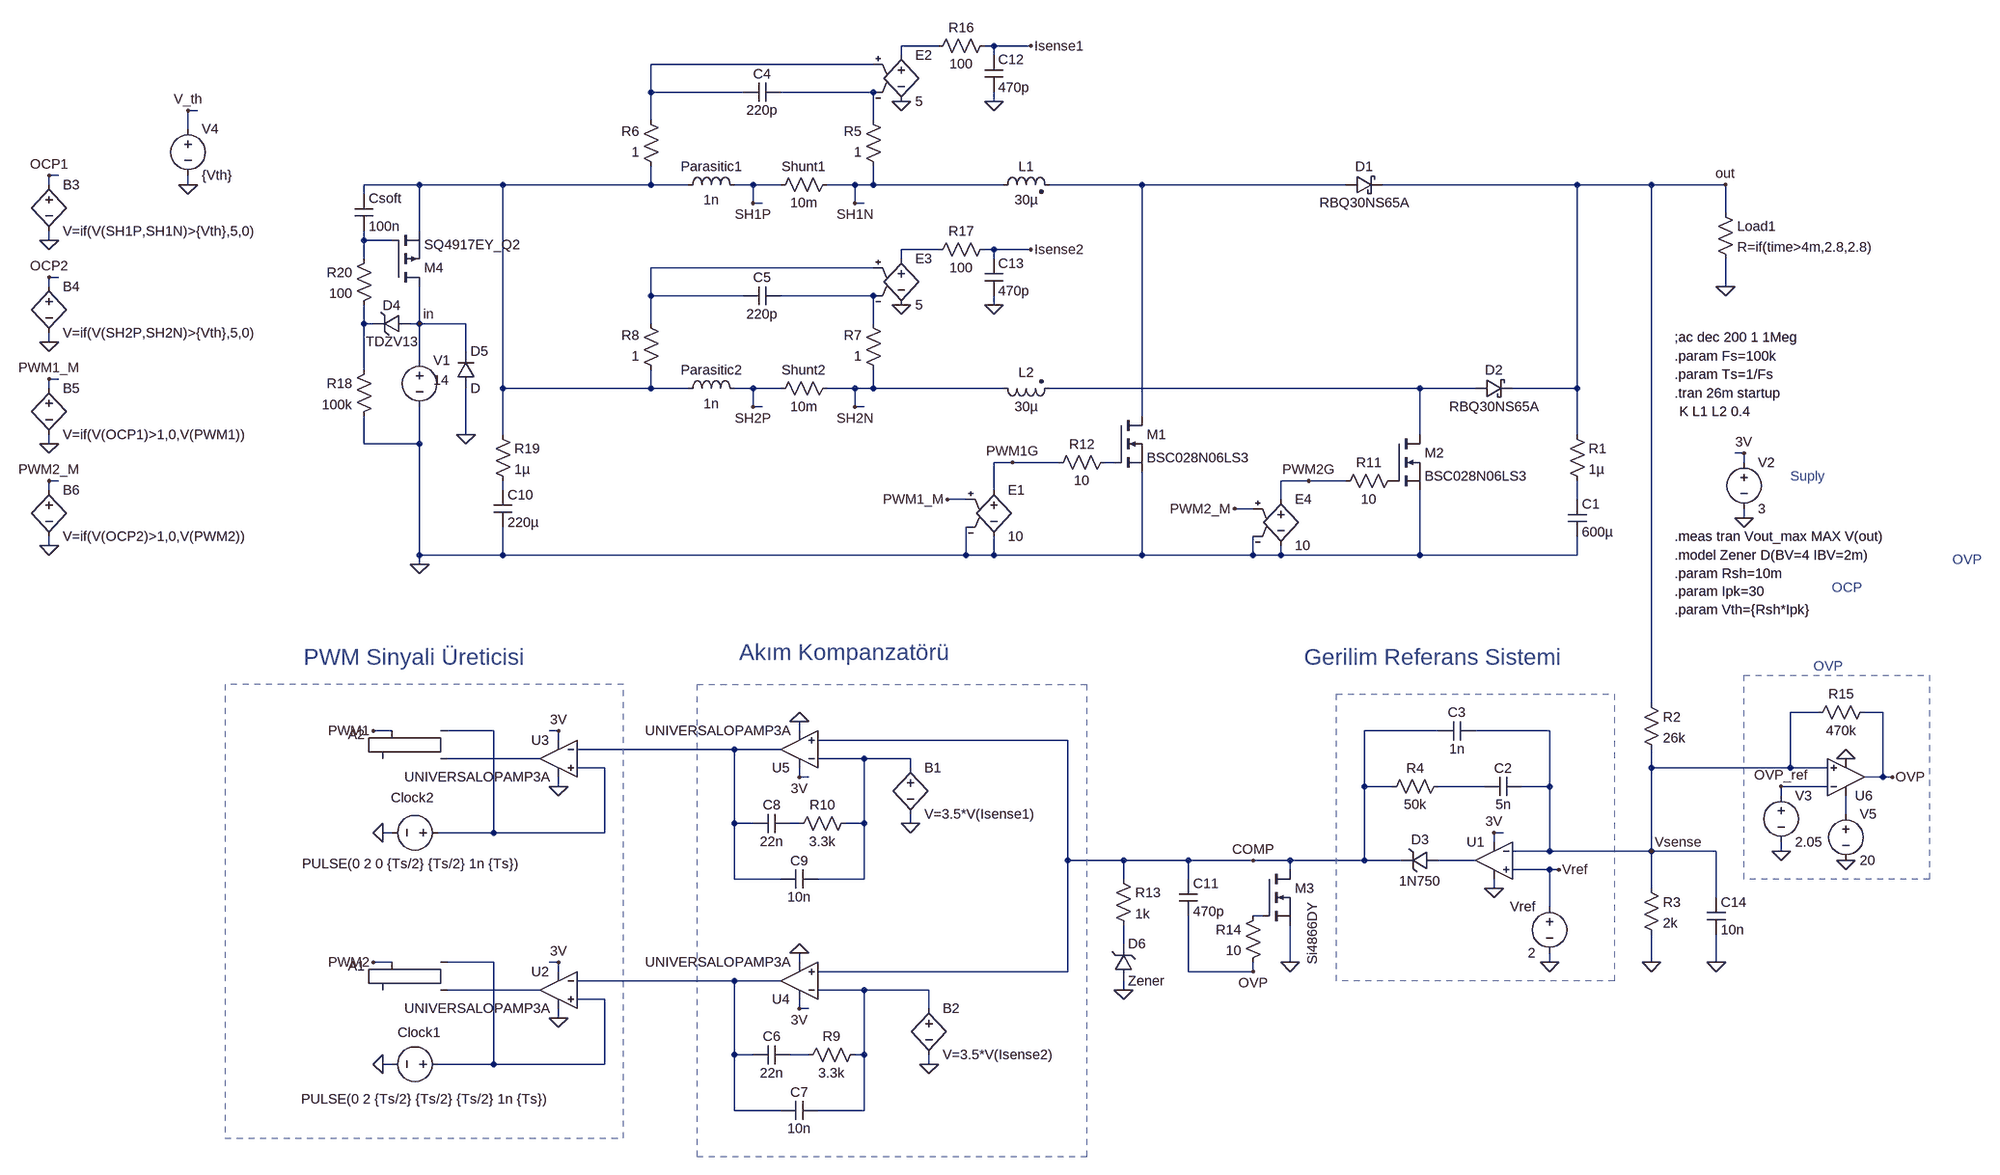
[diagram p0: schematic Analog_ACMC_variant.asc]
Analog_ACMC_variant.asc, the LTspice schematic file:
Version 4
SHEET 1 4392 1352
WIRE -112 -816 -176 -816
WIRE -16 -816 -32 -816
WIRE 48 -816 -16 -816
WIRE -176 -800 -176 -816
WIRE -16 -800 -16 -816
WIRE -224 -784 -608 -784
WIRE -608 -736 -608 -784
WIRE -448 -736 -608 -736
WIRE -224 -736 -384 -736
WIRE -16 -720 -16 -736
WIRE -1392 -704 -1408 -704
WIRE -608 -688 -608 -736
WIRE -224 -688 -224 -736
WIRE -1408 -672 -1408 -704
WIRE -1632 -592 -1648 -592
WIRE -1648 -576 -1648 -592
WIRE -1408 -576 -1408 -592
WIRE -1008 -576 -1104 -576
WIRE -864 -576 -1008 -576
WIRE -608 -576 -608 -608
WIRE -608 -576 -864 -576
WIRE -544 -576 -608 -576
WIRE -432 -576 -464 -576
WIRE -384 -576 -432 -576
WIRE -256 -576 -304 -576
WIRE -224 -576 -224 -608
WIRE -224 -576 -256 -576
WIRE 0 -576 -224 -576
WIRE 240 -576 80 -576
WIRE 592 -576 240 -576
WIRE 992 -576 656 -576
WIRE 1120 -576 992 -576
WIRE 1248 -576 1120 -576
WIRE -1104 -560 -1104 -576
WIRE -432 -544 -432 -576
WIRE -416 -544 -432 -544
WIRE -256 -544 -256 -576
WIRE -240 -544 -256 -544
WIRE 1248 -528 1248 -576
WIRE -1008 -496 -1008 -576
WIRE -1648 -480 -1648 -496
WIRE -1104 -480 -1104 -496
WIRE -1056 -480 -1104 -480
WIRE -112 -464 -176 -464
WIRE -16 -464 -32 -464
WIRE 48 -464 -16 -464
WIRE -1104 -448 -1104 -480
WIRE -176 -448 -176 -464
WIRE -16 -448 -16 -464
WIRE -224 -432 -608 -432
WIRE -1632 -416 -1648 -416
WIRE -1648 -400 -1648 -416
WIRE 1248 -400 1248 -448
WIRE -608 -384 -608 -432
WIRE -448 -384 -608 -384
WIRE -224 -384 -384 -384
WIRE -16 -368 -16 -384
WIRE -1104 -336 -1104 -368
WIRE -1088 -336 -1104 -336
WIRE -1008 -336 -1008 -400
WIRE -1008 -336 -1024 -336
WIRE -928 -336 -1008 -336
WIRE -608 -336 -608 -384
WIRE -224 -336 -224 -384
WIRE -1648 -304 -1648 -320
WIRE -928 -288 -928 -336
WIRE -1008 -272 -1008 -336
WIRE -1104 -256 -1104 -336
WIRE -1632 -240 -1648 -240
WIRE -1648 -224 -1648 -240
WIRE -864 -224 -864 -576
WIRE -608 -224 -608 -256
WIRE -608 -224 -864 -224
WIRE -544 -224 -608 -224
WIRE -432 -224 -464 -224
WIRE -384 -224 -432 -224
WIRE -256 -224 -304 -224
WIRE -224 -224 -224 -256
WIRE -224 -224 -256 -224
WIRE 0 -224 -224 -224
WIRE 720 -224 80 -224
WIRE 816 -224 720 -224
WIRE 992 -224 992 -576
WIRE 992 -224 880 -224
WIRE -432 -192 -432 -224
WIRE -416 -192 -432 -192
WIRE -256 -192 -256 -224
WIRE -240 -192 -256 -192
WIRE 240 -176 240 -576
WIRE -928 -144 -928 -224
WIRE -864 -144 -864 -224
WIRE 720 -144 720 -224
WIRE 992 -144 992 -224
WIRE -1648 -128 -1648 -144
WIRE -1104 -128 -1104 -176
WIRE -1008 -128 -1008 -192
WIRE -1008 -128 -1104 -128
WIRE 1280 -112 1264 -112
WIRE 16 -96 -16 -96
WIRE 96 -96 16 -96
WIRE 192 -96 176 -96
WIRE 1280 -96 1280 -112
WIRE -1632 -64 -1648 -64
WIRE 528 -64 480 -64
WIRE 592 -64 528 -64
WIRE -1648 -48 -1648 -64
WIRE -864 -48 -864 -64
WIRE -16 -48 -16 -96
WIRE -64 -32 -96 -32
WIRE 480 -32 480 -64
WIRE 992 -32 992 -64
WIRE 432 -16 400 -16
WIRE 1280 0 1280 -16
WIRE -1648 48 -1648 32
WIRE -1008 64 -1008 -128
WIRE -864 64 -864 16
WIRE -864 64 -1008 64
WIRE -64 64 -64 16
WIRE -64 64 -864 64
WIRE -16 64 -16 32
WIRE -16 64 -64 64
WIRE 240 64 240 -80
WIRE 240 64 -16 64
WIRE 432 64 432 32
WIRE 432 64 240 64
WIRE 480 64 480 48
WIRE 480 64 432 64
WIRE 720 64 720 -48
WIRE 720 64 480 64
WIRE 992 64 992 32
WIRE 992 64 720 64
WIRE -1008 80 -1008 64
WIRE 1120 320 1120 -576
WIRE 1408 336 1360 336
WIRE 1520 336 1488 336
WIRE -1056 368 -1088 368
WIRE -880 368 -960 368
WIRE -768 368 -784 368
WIRE -352 368 -352 352
WIRE 752 368 624 368
WIRE 944 368 816 368
WIRE -768 384 -768 368
WIRE 112 384 -320 384
WIRE -464 400 -736 400
WIRE -384 400 -464 400
WIRE -800 416 -960 416
WIRE -240 416 -320 416
WIRE -160 416 -240 416
WIRE -688 432 -736 432
WIRE -160 432 -160 416
WIRE 1120 432 1120 400
WIRE 1360 432 1360 336
WIRE 1360 432 1120 432
WIRE 1424 432 1360 432
WIRE 1456 432 1456 416
WIRE -352 448 -352 432
WIRE -336 448 -352 448
WIRE 1520 448 1520 336
WIRE 1520 448 1488 448
WIRE 1536 448 1520 448
WIRE -768 464 -768 448
WIRE 624 464 624 368
WIRE 672 464 624 464
WIRE 832 464 752 464
WIRE 944 464 944 368
WIRE 944 464 896 464
WIRE 1424 464 1344 464
WIRE 1344 480 1344 464
WIRE 1456 512 1456 480
WIRE -464 528 -464 400
WIRE -432 528 -464 528
WIRE -352 528 -368 528
WIRE -240 528 -240 416
WIRE -240 528 -272 528
WIRE -160 528 -160 512
WIRE -1056 544 -1072 544
WIRE -880 544 -880 368
WIRE -880 544 -976 544
WIRE -688 544 -688 432
WIRE -688 544 -880 544
WIRE 864 544 848 544
WIRE 848 560 848 544
WIRE 944 576 944 464
WIRE 944 576 880 576
WIRE 1120 576 1120 432
WIRE 1120 576 944 576
WIRE 1232 576 1120 576
WIRE 1344 576 1344 560
WIRE 112 592 112 384
WIRE 208 592 112 592
WIRE 320 592 208 592
WIRE 432 592 320 592
WIRE 496 592 432 592
WIRE 624 592 624 464
WIRE 624 592 496 592
WIRE 688 592 624 592
WIRE 816 592 752 592
WIRE 496 608 496 592
WIRE 944 608 880 608
WIRE 960 608 944 608
WIRE -464 624 -464 528
WIRE -384 624 -464 624
WIRE -240 624 -240 528
WIRE -240 624 -320 624
WIRE 208 624 208 592
WIRE 320 624 320 592
WIRE 848 640 848 624
WIRE 1120 640 1120 576
WIRE 1232 656 1232 576
WIRE 944 672 944 608
WIRE 448 688 432 688
WIRE 208 736 208 704
WIRE -1056 768 -1088 768
WIRE -880 768 -960 768
WIRE -768 768 -784 768
WIRE -352 768 -352 752
WIRE 496 768 496 704
WIRE 944 768 944 752
WIRE 1120 768 1120 720
WIRE 1232 768 1232 720
WIRE -768 784 -768 768
WIRE 112 784 112 592
WIRE 112 784 -320 784
WIRE 320 784 320 688
WIRE 432 784 432 768
WIRE 432 784 320 784
WIRE -464 800 -736 800
WIRE -384 800 -464 800
WIRE -800 816 -960 816
WIRE -240 816 -320 816
WIRE -128 816 -240 816
WIRE 208 816 208 800
WIRE -688 832 -736 832
WIRE -352 848 -352 832
WIRE -336 848 -352 848
WIRE -128 848 -128 816
WIRE -768 864 -768 848
WIRE -464 928 -464 800
WIRE -432 928 -464 928
WIRE -336 928 -368 928
WIRE -240 928 -240 816
WIRE -240 928 -256 928
WIRE -1056 944 -1072 944
WIRE -880 944 -880 768
WIRE -880 944 -976 944
WIRE -688 944 -688 832
WIRE -688 944 -880 944
WIRE -128 944 -128 928
WIRE -464 1024 -464 928
WIRE -384 1024 -464 1024
WIRE -240 1024 -240 928
WIRE -240 1024 -320 1024
FLAG -1008 80 0
FLAG -1008 -336 in
FLAG 1248 -576 out
FLAG 1120 768 0
FLAG 1280 0 0
FLAG 944 768 0
FLAG 1280 -112 3V
FLAG 848 640 0
FLAG -176 -720 0
FLAG -1072 944 0
FLAG 1248 -400 0
FLAG 48 -816 Isense1
FLAG -768 864 0
FLAG -176 -368 0
FLAG 48 -464 Isense2
FLAG -768 464 0
FLAG -1072 544 0
FLAG -160 528 0
FLAG -128 944 0
FLAG -352 752 0
FLAG -352 352 0
FLAG 960 608 Vref
FLAG 1120 576 Vsense
FLAG -1088 368 PWM1
FLAG -1088 768 PWM2
FLAG -96 -32 PWM1_M
FLAG 400 -16 PWM2_M
FLAG 208 816 0
FLAG 848 544 3V
FLAG -768 368 3V
FLAG 1456 416 0
FLAG 1536 448 OVP
FLAG 496 768 0
FLAG 1344 576 0
FLAG 1344 464 OVP_ref
FLAG 1456 592 0
FLAG 432 784 OVP
FLAG -16 -720 0
FLAG -16 -368 0
FLAG 16 -96 PWM1G
FLAG 528 -64 PWM2G
FLAG -432 -544 SH1P
FLAG -256 -544 SH1N
FLAG -432 -192 SH2P
FLAG -256 -192 SH2N
FLAG -1648 -480 0
FLAG -1648 -304 0
FLAG -1648 -592 OCP1
FLAG -1648 -416 OCP2
FLAG -1648 -128 0
FLAG -1648 48 0
FLAG -1648 -240 PWM1_M
FLAG -1648 -64 PWM2_M
FLAG -1408 -576 0
FLAG -1408 -704 V_th
FLAG 432 592 COMP
FLAG 1232 768 0
FLAG -928 -144 0
FLAG -352 448 3V
FLAG -352 848 3V
FLAG -768 768 3V
SYMBOL res 1232 -544 R0
SYMATTR InstName Load1
SYMATTR Value R=if(time>4m,2.8,2.8)
SYMBOL nmos 192 -176 R0
SYMATTR InstName M1
SYMATTR Value BSC028N06LS3
SYMBOL ind2 -16 -560 R270
WINDOW 0 32 56 VTop 2
WINDOW 3 5 56 VBottom 2
SYMATTR InstName L1
SYMATTR Value 30µ
SYMATTR Type ind
SYMATTR SpiceLine Rser=1u
SYMBOL res -400 -560 R270
WINDOW 0 32 56 VTop 2
WINDOW 3 0 56 VBottom 2
SYMATTR InstName Shunt1
SYMATTR Value 10m
SYMBOL res 976 -160 R0
SYMATTR InstName R1
SYMATTR Value 1µ
SYMBOL cap 976 -32 R0
SYMATTR InstName C1
SYMATTR Value 600µ
SYMBOL e -16 -64 R0
SYMATTR InstName E1
SYMATTR Value 10
SYMBOL Digital\\srflop -1008 720 M0
SYMATTR InstName A1
SYMBOL res 1104 304 R0
SYMATTR InstName R2
SYMATTR Value 26k
SYMBOL res 1104 624 R0
SYMATTR InstName R3
SYMATTR Value 2k
SYMBOL voltage 1280 -112 R0
WINDOW 123 0 0 Left 0
WINDOW 39 0 0 Left 0
SYMATTR InstName V2
SYMATTR Value 3
SYMBOL OpAmps\\UniversalOpAmp2 848 592 M0
SYMATTR InstName U1
SYMBOL res 768 448 R90
WINDOW 0 0 56 VBottom 2
WINDOW 3 32 56 VTop 2
SYMATTR InstName R4
SYMATTR Value 50k
SYMBOL cap 896 448 R90
WINDOW 0 0 32 VBottom 2
WINDOW 3 32 32 VTop 2
SYMATTR InstName C2
SYMATTR Value 5n
SYMBOL cap 752 384 R270
WINDOW 0 32 32 VTop 2
WINDOW 3 0 32 VBottom 2
SYMATTR InstName C3
SYMATTR Value 1n
SYMBOL ind -560 -560 R270
WINDOW 0 32 56 VTop 2
WINDOW 3 5 56 VBottom 2
SYMATTR InstName Parasitic1
SYMATTR Value 1n
SYMBOL res -208 -592 R180
WINDOW 0 36 76 Left 2
WINDOW 3 36 40 Left 2
SYMATTR InstName R5
SYMATTR Value 1
SYMBOL res -592 -592 R180
WINDOW 0 36 76 Left 2
WINDOW 3 36 40 Left 2
SYMATTR InstName R6
SYMATTR Value 1
SYMBOL cap -448 -720 R270
WINDOW 0 32 32 VTop 2
WINDOW 3 0 32 VBottom 2
SYMATTR InstName C4
SYMATTR Value 220p
SYMBOL e -176 -816 R0
SYMATTR InstName E2
SYMATTR Value 5
SYMBOL voltage -960 944 R90
WINDOW 0 -70 49 VTop 2
WINDOW 3 76 41 VBottom 2
WINDOW 123 0 0 Left 0
WINDOW 39 0 0 Left 0
SYMATTR InstName Clock1
SYMATTR Value PULSE(0 2 {Ts/2} {Ts/2} {Ts/2} 1n {Ts})
SYMBOL OpAmps\\UniversalOpAmp3a -768 816 M0
SYMATTR InstName U2
SYMBOL schottky 592 -560 R270
WINDOW 0 32 32 VTop 2
WINDOW 3 0 32 VBottom 2
SYMATTR InstName D1
SYMATTR Value RBQ30NS65A
SYMATTR Description Diode
SYMATTR Type diode
SYMBOL ind2 -16 -240 M90
WINDOW 0 4 56 VBottom 2
WINDOW 3 32 56 VTop 2
SYMATTR InstName L2
SYMATTR Value 30µ
SYMATTR Type ind
SYMATTR SpiceLine Rser=1u
SYMBOL schottky 816 -208 R270
WINDOW 0 32 32 VTop 2
WINDOW 3 0 32 VBottom 2
SYMATTR InstName D2
SYMATTR Value RBQ30NS65A
SYMATTR Description Diode
SYMATTR Type diode
SYMBOL nmos 672 -144 R0
SYMATTR InstName M2
SYMATTR Value BSC028N06LS3
SYMBOL res -400 -208 R270
WINDOW 0 32 56 VTop 2
WINDOW 3 0 56 VBottom 2
SYMATTR InstName Shunt2
SYMATTR Value 10m
SYMBOL ind -560 -208 R270
WINDOW 0 32 56 VTop 2
WINDOW 3 5 56 VBottom 2
SYMATTR InstName Parasitic2
SYMATTR Value 1n
SYMBOL res -208 -240 R180
WINDOW 0 36 76 Left 2
WINDOW 3 36 40 Left 2
SYMATTR InstName R7
SYMATTR Value 1
SYMBOL res -592 -240 R180
WINDOW 0 36 76 Left 2
WINDOW 3 36 40 Left 2
SYMATTR InstName R8
SYMATTR Value 1
SYMBOL cap -448 -368 R270
WINDOW 0 32 32 VTop 2
WINDOW 3 0 32 VBottom 2
SYMATTR InstName C5
SYMATTR Value 220p
SYMBOL e -176 -464 R0
SYMATTR InstName E3
SYMATTR Value 5
SYMBOL OpAmps\\UniversalOpAmp3a -768 416 M0
SYMATTR InstName U3
SYMBOL bv -160 416 R0
SYMATTR InstName B1
SYMATTR Value V=3.5*V(Isense1)
SYMBOL Digital\\srflop -1008 320 M0
SYMATTR InstName A2
SYMBOL voltage -960 544 R90
WINDOW 0 -76 61 VTop 2
WINDOW 3 69 64 VBottom 2
WINDOW 123 0 0 Left 0
WINDOW 39 0 0 Left 0
SYMATTR InstName Clock2
SYMATTR Value PULSE(0 2 0 {Ts/2} {Ts/2} 1n {Ts})
SYMBOL e 480 -48 R0
SYMATTR InstName E4
SYMATTR Value 10
SYMBOL zener 752 576 R90
WINDOW 0 -4 32 VBottom 2
WINDOW 3 36 32 VTop 2
SYMATTR InstName D3
SYMATTR Value 1N750
SYMBOL bv -128 832 R0
SYMATTR InstName B2
SYMATTR Value V=3.5*V(Isense2)
SYMBOL OpAmps\\UniversalOpAmp3a -352 800 R180
SYMATTR InstName U4
SYMBOL res -352 944 R270
WINDOW 0 32 56 VTop 2
WINDOW 3 0 56 VBottom 2
SYMATTR InstName R9
SYMATTR Value 3.3k
SYMBOL cap -432 944 R270
WINDOW 0 32 32 VTop 2
WINDOW 3 0 32 VBottom 2
SYMATTR InstName C6
SYMATTR Value 22n
SYMBOL cap -320 1008 R90
WINDOW 0 0 32 VBottom 2
WINDOW 3 32 32 VTop 2
SYMATTR InstName C7
SYMATTR Value 10n
SYMBOL OpAmps\\UniversalOpAmp3a -352 400 R180
SYMATTR InstName U5
SYMBOL res -368 544 R270
WINDOW 0 32 56 VTop 2
WINDOW 3 0 56 VBottom 2
SYMATTR InstName R10
SYMATTR Value 3.3k
SYMBOL cap -432 544 R270
WINDOW 0 32 32 VTop 2
WINDOW 3 0 32 VBottom 2
SYMATTR InstName C8
SYMATTR Value 22n
SYMBOL cap -320 608 R90
WINDOW 0 0 32 VBottom 2
WINDOW 3 32 32 VTop 2
SYMATTR InstName C9
SYMATTR Value 10n
SYMBOL res 688 -80 R90
WINDOW 0 0 56 VBottom 2
WINDOW 3 32 56 VTop 2
SYMATTR InstName R11
SYMATTR Value 10
SYMBOL res 192 -112 R90
WINDOW 0 0 56 VBottom 2
WINDOW 3 32 56 VTop 2
SYMATTR InstName R12
SYMATTR Value 10
SYMBOL cap -880 -48 R0
SYMATTR InstName C10
SYMATTR Value 220µ
SYMBOL res 192 608 R0
SYMATTR InstName R13
SYMATTR Value 1k
SYMBOL voltage 944 656 M0
WINDOW 123 0 0 Left 0
WINDOW 39 0 0 Left 0
SYMATTR InstName Vref
SYMATTR Value 2
SYMBOL OpAmps\\UniversalOpAmp2 1456 448 M180
SYMATTR InstName U6
SYMBOL zener 192 800 M180
WINDOW 0 24 64 Left 2
WINDOW 3 24 0 Left 2
SYMATTR InstName D6
SYMATTR Value Zener
SYMATTR Description Diode
SYMATTR Type diode
SYMBOL nmos 448 608 R0
WINDOW 3 87 56 VRight 2
SYMATTR Value Si4866DY
SYMATTR InstName M3
SYMBOL voltage 1344 464 R0
WINDOW 123 0 0 Left 0
WINDOW 39 0 0 Left 0
SYMATTR InstName V3
SYMATTR Value 2.05
SYMBOL res 448 672 M0
SYMATTR InstName R14
SYMATTR Value 10
SYMBOL cap 304 624 R0
SYMATTR InstName C11
SYMATTR Value 470p
SYMBOL voltage 1456 496 R0
WINDOW 123 0 0 Left 0
WINDOW 39 0 0 Left 0
SYMATTR InstName V5
SYMATTR Value 20
SYMBOL res 1504 320 R90
WINDOW 0 0 56 VBottom 2
WINDOW 3 32 56 VTop 2
SYMATTR InstName R15
SYMATTR Value 470k
SYMBOL res -16 -832 R90
WINDOW 0 0 56 VBottom 2
WINDOW 3 32 56 VTop 2
SYMATTR InstName R16
SYMATTR Value 100
SYMBOL cap -32 -800 R0
SYMATTR InstName C12
SYMATTR Value 470p
SYMBOL cap -32 -448 R0
SYMATTR InstName C13
SYMATTR Value 470p
SYMBOL res -16 -480 R90
WINDOW 0 0 56 VBottom 2
WINDOW 3 32 56 VTop 2
SYMATTR InstName R17
SYMATTR Value 100
SYMBOL bv -1648 -592 R0
SYMATTR InstName B3
SYMATTR Value V=if(V(SH1P,SH1N)>{Vth},5,0)
SYMBOL bv -1648 -416 R0
SYMATTR InstName B4
SYMATTR Value V=if(V(SH2P,SH2N)>{Vth},5,0)
SYMBOL bv -1648 -240 R0
SYMATTR InstName B5
SYMATTR Value V=if(V(OCP1)>1,0,V(PWM1))
SYMBOL bv -1648 -64 R0
SYMATTR InstName B6
SYMATTR Value V=if(V(OCP2)>1,0,V(PWM2))
SYMBOL voltage -1408 -688 R0
SYMATTR InstName V4
SYMATTR Value {Vth}
SYMBOL pmos -1056 -400 M180
SYMATTR InstName M4
SYMATTR Value SQ4917EY_Q2
SYMBOL res -1088 -272 M0
SYMATTR InstName R18
SYMATTR Value 100k
SYMBOL zener -1024 -352 R90
WINDOW 0 0 32 VBottom 2
WINDOW 3 32 32 VTop 2
SYMATTR InstName D4
SYMATTR Value TDZV13
SYMATTR Description Diode
SYMATTR Type diode
SYMBOL res -880 -160 R0
SYMATTR InstName R19
SYMATTR Value 1µ
SYMBOL voltage -1008 -288 R0
WINDOW 123 24 50 Left 2
WINDOW 39 0 0 Left 0
WINDOW 3 24 50 Left 2
SYMATTR Value 14
SYMATTR InstName V1
SYMBOL cap 1216 656 R0
SYMATTR InstName C14
SYMATTR Value 10n
SYMBOL cap -1120 -560 R0
SYMATTR InstName Csoft
SYMATTR Value 100n
SYMBOL res -1088 -464 M0
SYMATTR InstName R20
SYMATTR Value 100
SYMBOL diode -944 -224 M180
WINDOW 0 24 64 Left 2
WINDOW 3 24 0 Left 2
SYMATTR InstName D5
TEXT 1160 -280 Left 2 !.param Fs=100k
TEXT 1160 -248 Left 2 !.param Ts=1/Fs
TEXT 1160 -216 Left 2 !.tran 26m startup
TEXT 1160 -312 Left 2 !;ac dec 200 1 1Meg
TEXT 1168 -184 Left 2 !K L1 L2 0.4
TEXT -1208 240 Left 4 ;PWM Sinyali Üreticisi
TEXT -456 232 Left 4 ;Akım Kompanzatörü
TEXT 520 240 Left 4 ;Gerilim Referans Sistemi
TEXT 1160 64 Left 2 !.model Zener D(BV=4 IBV=2m)
TEXT 1160 32 Left 2 !.meas tran Vout_max MAX V(out)
TEXT 1400 256 Left 2 ;OVP
TEXT 1432 120 Left 2 ;OCP
TEXT 1640 72 Left 2 ;OVP
TEXT 1360 -72 Left 2 ;Suply
TEXT 1160 96 Left 2 !.param Rsh=10m\n.param Ipk=30\n.param Vth={Rsh*Ipk}
RECTANGLE Normal 144 1104 -528 288 1
RECTANGLE Normal -1344 1072 -656 288 1
RECTANGLE Normal 1056 800 576 304 1
RECTANGLE Normal 1600 624 1280 272 2

The netlist it stands for:
* Analog_ACMC_variant.asc
R§Load1 out 0 R=if(time>4m,2.8,2.8)
M1 N005 N012 0 0 BSC028N06LS3
L1 SH1N N005 30µ Rser=1u
R§Shunt1 SH1P SH1N 10m
R1 out N014 1µ
C1 N014 0 600µ
E1 PWM1G 0 PWM1_M 0 10
A1 N025 N027 0 0 0 0 PWM2 0 SRFLOP
R2 out Vsense 26k
R3 Vsense 0 2k
V2 3V 0 3
XU1 Vref Vsense 3V 0 N022 level2 Avol=1Meg GBW=10Meg Slew=10Meg Ilimit=25m Rail=0 Vos=0 En=0 Enk=0 In=0 Ink=0 Rin=500Meg  ; pins In+ In- V+ V- OUT
R4 N019 COMP 50k
C2 Vsense N019 5n
C3 COMP Vsense 1n
L§Parasitic1 N004 SH1P 1n
R5 SH1N N003 1
R6 N004 N002 1
C4 N002 N003 220p
E2 N001 0 N002 N003 5
V§Clock1 N025 0 PULSE(0 2 {Ts/2} {Ts/2} {Ts/2} 1n {Ts})
XU2 N025 N026 3V 0 N027 level3a Avol=1Meg GBW=10Meg Slew=10Meg Ilimit=25m Rail=0 Vos=0 Phimargin=45 En=0 Enk=0 In=0 Ink=0 Rin=500Meg  ; UNIVERSALOPAMP3A, pins In+ In- V+ V- OUT
D1 N005 out RBQ30NS65A
L2 SH2N N011 30µ Rser=1u
D2 N011 out RBQ30NS65A
M2 N011 P001 0 0 BSC028N06LS3
R§Shunt2 SH2P SH2N 10m
L§Parasitic2 N004 SH2P 1n
R7 SH2N N009 1
R8 N004 N008 1
C5 N008 N009 220p
E3 N007 0 N008 N009 5
XU3 N015 N016 3V 0 N017 level3a Avol=1Meg GBW=10Meg Slew=10Meg Ilimit=25m Rail=0 Vos=0 Phimargin=45 En=0 Enk=0 In=0 Ink=0 Rin=500Meg  ; UNIVERSALOPAMP3A, pins In+ In- V+ V- OUT
B1 N018 0 V=3.5*V(Isense1)
A2 N015 N017 0 0 0 0 PWM1 0 SRFLOP
V§Clock2 N015 0 PULSE(0 2 0 {Ts/2} {Ts/2} 1n {Ts})
E4 PWM2G 0 PWM2_M 0 10
D3 N022 COMP 1N750
B2 N028 0 V=3.5*V(Isense2)
XU4 COMP N028 3V 0 N026 level3a Avol=1Meg GBW=10Meg Slew=10Meg Ilimit=25m Rail=0 Vos=0 Phimargin=45 En=0 Enk=0 In=0 Ink=0 Rin=500Meg  ; UNIVERSALOPAMP3A, pins In+ In- V+ V- OUT
R9 N029 N028 3.3k
C6 N026 N029 22n
C7 N028 N026 10n
XU5 COMP N018 3V 0 N016 level3a Avol=1Meg GBW=10Meg Slew=10Meg Ilimit=25m Rail=0 Vos=0 Phimargin=45 En=0 Enk=0 In=0 Ink=0 Rin=500Meg  ; UNIVERSALOPAMP3A, pins In+ In- V+ V- OUT
R10 N021 N018 3.3k
C8 N016 N021 22n
C9 N018 N016 10n
R11 P001 PWM2G 10
R12 N012 PWM1G 10
C10 N013 0 220µ
R13 COMP N024 1k
Vref Vref 0 2
XU6 Vsense OVP_ref N020 0 OVP level2 Avol=1Meg GBW=10Meg Slew=10Meg Ilimit=25m Rail=0 Vos=0 En=0 Enk=0 In=0 Ink=0 Rin=500Meg  ; pins In+ In- V+ V- OUT
D6 0 N024 Zener
M3 COMP N023 0 0 Si4866DY
V3 OVP_ref 0 2.05
R14 N023 OVP 10
C11 COMP OVP 470p
V5 N020 0 20
R15 OVP Vsense 470k
R16 Isense1 N001 100
C12 Isense1 0 470p
C13 Isense2 0 470p
R17 Isense2 N007 100
B3 OCP1 0 V=if(V(SH1P,SH1N)>{Vth},5,0)
B4 OCP2 0 V=if(V(SH2P,SH2N)>{Vth},5,0)
B5 PWM1_M 0 V=if(V(OCP1)>1,0,V(PWM1))
B6 PWM2_M 0 V=if(V(OCP2)>1,0,V(PWM2))
V4 V_th 0 {Vth}
M4 in N006 N004 N004 SQ4917EY_Q2
R18 N010 0 100k
D4 in N010 TDZV13
R19 N004 N013 1µ
V1 in 0 14
C14 Vsense 0 10n
Csoft N004 N006 100n
R20 N006 N010 100
D5 0 in D
.model D D
.lib standard.dio
.model NMOS NMOS
.model PMOS PMOS
.lib standard.mos
.param Fs=100k
.param Ts=1/Fs
.tran 26m startup
;ac dec 200 1 1Meg
K L1 L2 0.4
* PWM Sinyali Üreticisi
* Akım Kompanzatörü
* Gerilim Referans Sistemi
.model Zener D(BV=4 IBV=2m)
.meas tran Vout_max MAX V(out)
* OVP
* OCP
* OVP
* Suply
.param Rsh=10m
.param Ipk=30
.param Vth={Rsh*Ipk}
.lib UniversalOpAmp2.lib
.backanno
.end